# Altium schematic sheet Schematic.SchDoc
size C; SheetNumber: 1; SheetTotal: 1
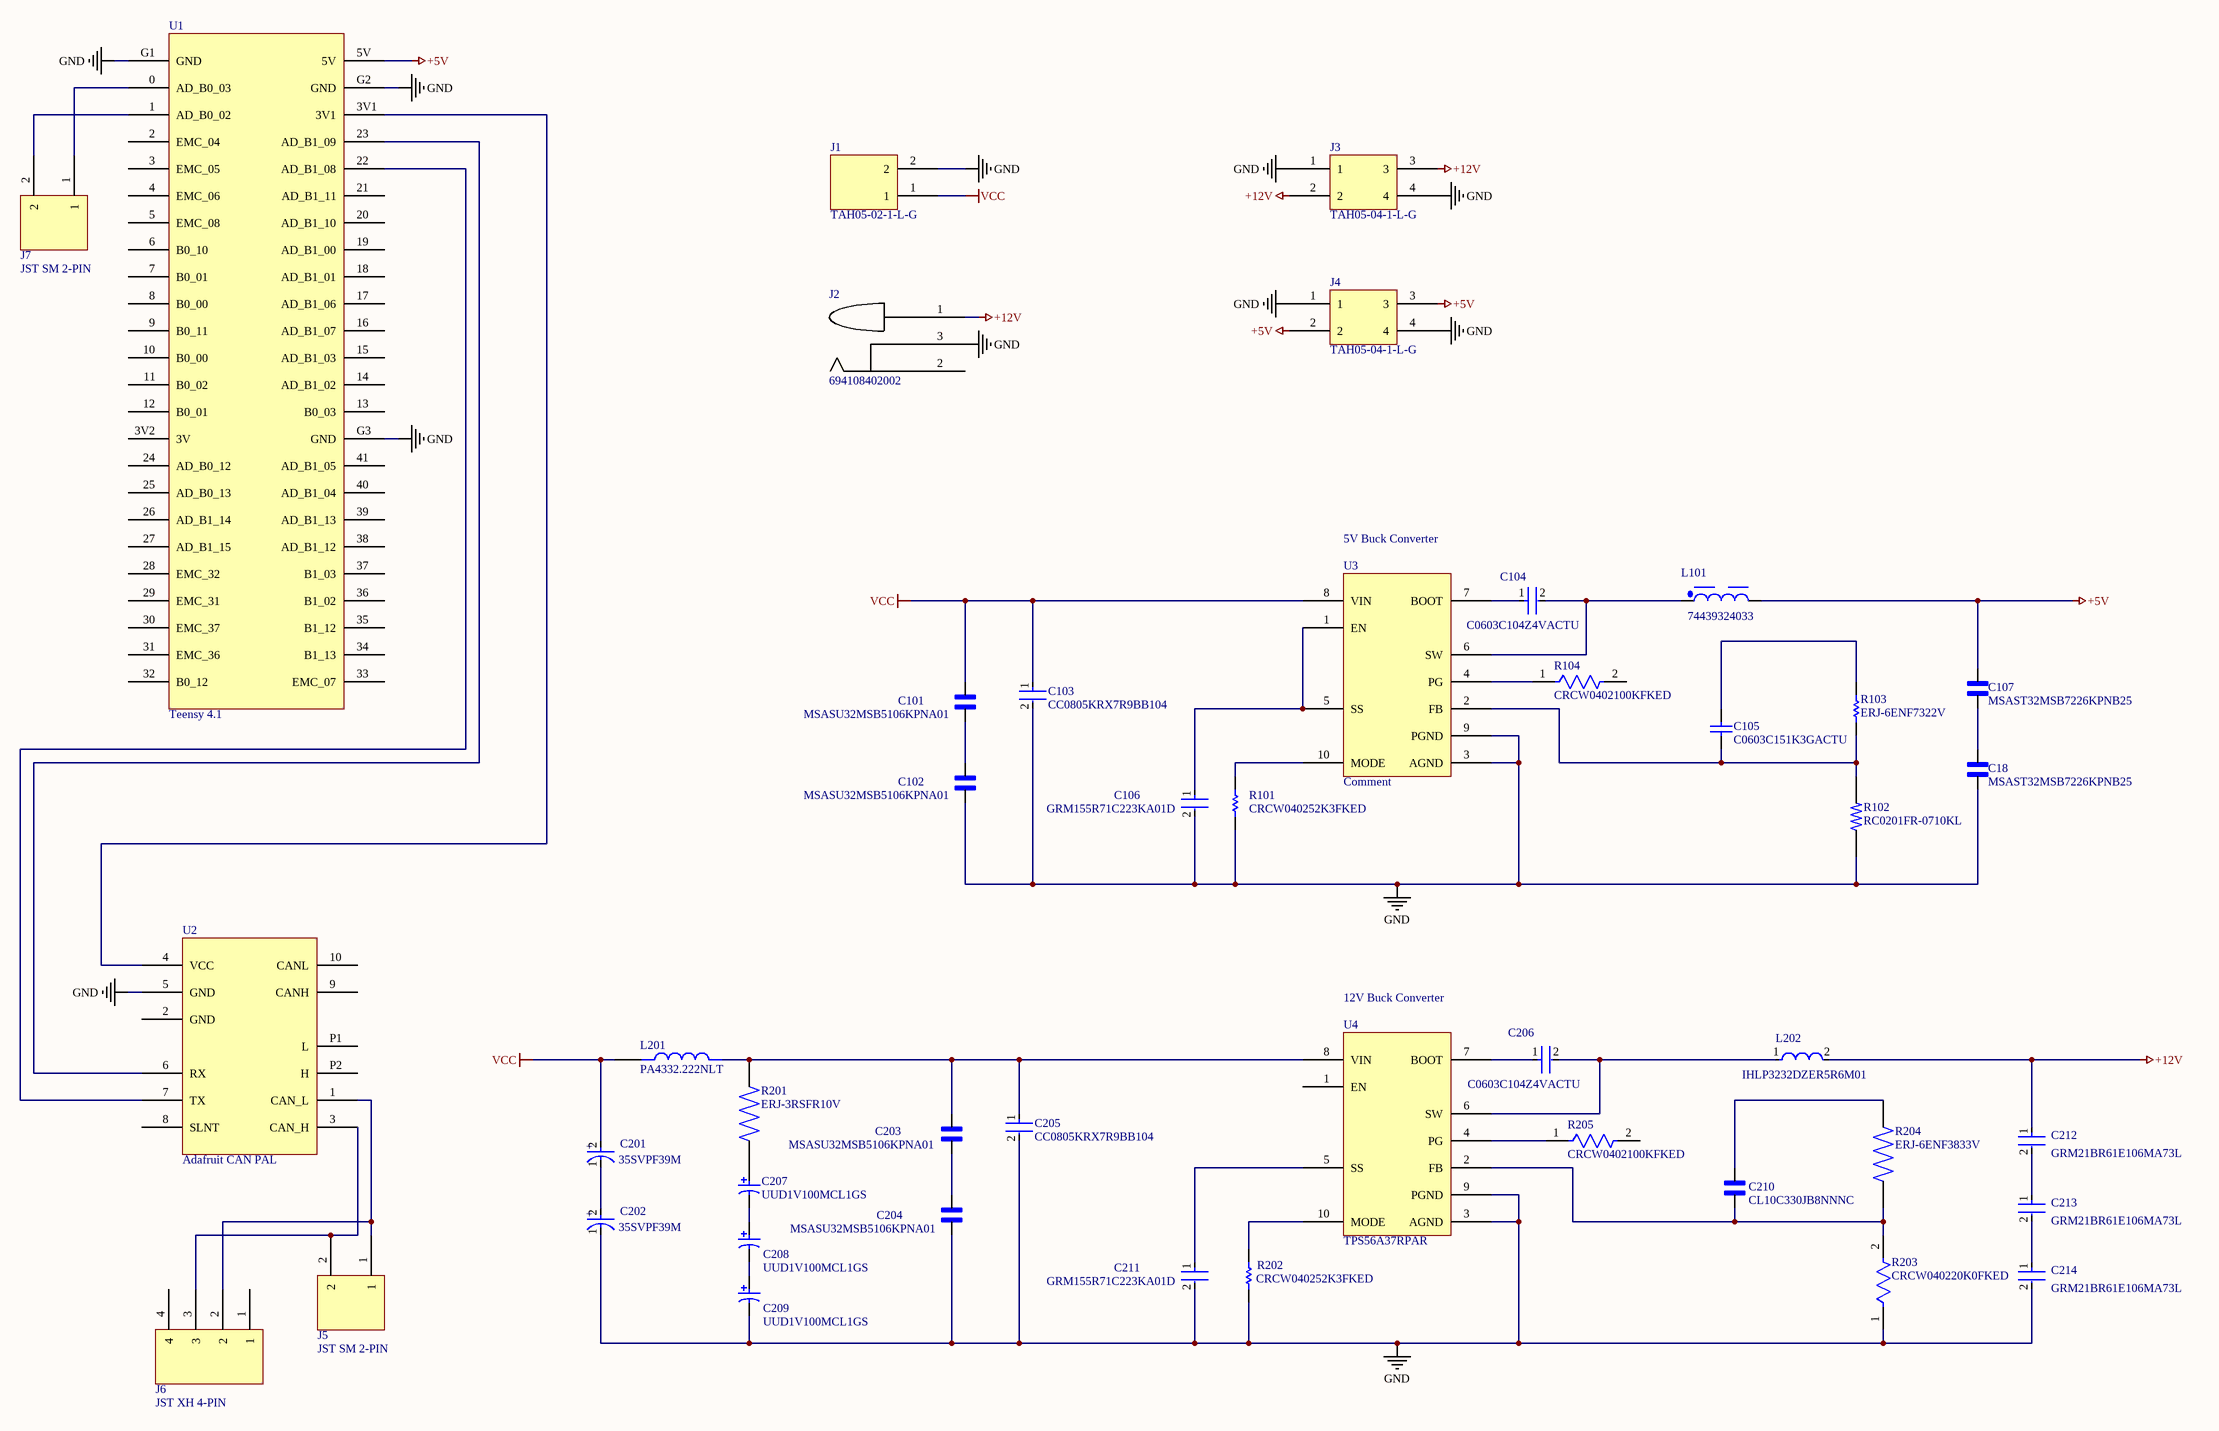
[diagram p0: Schematic.SchDoc]

## Parts
C18  MSAST32MSB7226KPNB25  [CAPC3225X270N]
C101  MSASU32MSB5106KPNA01  [CAPC3225X270N]
C102  MSASU32MSB5106KPNA01  [CAPC3225X270N]
C103  CC0805KRX7R9BB104  [FP-CC0805-0_85-MFG]
C104  C0603C104Z4VACTU  [FP-C0603C104Z4VACTU-MFG]
C105  C0603C151K3GACTU  [CAPC1608X87X35NL15T15]
C106  GRM155R71C223KA01D  [FP-GRM155-0_05-MFG]
C107  MSAST32MSB7226KPNB25  [CAPC3225X270N]
C201  35SVPF39M  [FP-OS-CON-SMT-E7-MFG]
C202  35SVPF39M  [FP-OS-CON-SMT-E7-MFG]
C203  MSASU32MSB5106KPNA01  [CAPC3225X270N]
C204  MSASU32MSB5106KPNA01  [CAPC3225X270N]
C205  CC0805KRX7R9BB104  [FP-CC0805-0_85-MFG]
C206  C0603C104Z4VACTU  [FP-C0603C104Z4VACTU-MFG]
C207  UUD1V100MCL1GS  [NIC-CAPA2-5X5.8_V]
C208  UUD1V100MCL1GS  [NIC-CAPA2-5X5.8_V]
C209  UUD1V100MCL1GS  [NIC-CAPA2-5X5.8_V]
C210  CL10C330JB8NNNC  [CL10C330JB8NNNC]
C211  GRM155R71C223KA01D  [FP-GRM155-0_05-MFG]
C212  GRM21BR61E106MA73L  [FP-GRM21B-0_15-IPC_A]
C213  GRM21BR61E106MA73L  [FP-GRM21B-0_15-IPC_A]
C214  GRM21BR61E106MA73L  [FP-GRM21B-0_15-IPC_A]
J1  TAH05-02-1-L-G  [TAH05-02-1-L-G]
J2  694108402002  [694108402002]
J3  TAH05-04-1-L-G  [TAH05-04-1-L-G]
J4  TAH05-04-1-L-G  [TAH05-04-1-L-G]
J5  JST SM 2-PIN  [JST SM 2-PIN]
J6  JST XH 4-PIN  [JST XH 4-PIN]
J7  JST SM 2-PIN  [JST SM 2-PIN]
L101  74439324033  [WE-XHMI_4030]
L201  PA4332.222NLT  [PA4332.222NLT]
L202  IHLP3232DZER5R6M01  [FP-IHLP-3232DZ-FP_2_413x5-MFG]
R101  CRCW040252K3FKED  [RESC1005X40X25LL05T05]
R102  RC0201FR-0710KL  [RESC0603X26N]
R103  ERJ-6ENF7322V  [RESC2013X70X40LL20T20]
R104  CRCW0402100KFKED  [FP-CRCW0402-e3-IPC_C]
R201  ERJ-3RSFR10V  [ERJ-3RSFR10V]
R202  CRCW040252K3FKED  [RESC1005X40X25LL05T05]
R203  CRCW040220K0FKED  [FP-CRCW0402-e3-IPC_B]
R204  ERJ-6ENF3833V  [RESC2012X70N]
R205  CRCW0402100KFKED  [FP-CRCW0402-e3-IPC_C]
U1  Teensy 4.1  [Teensy 4.1]
U2  Adafruit CAN PAL  [ADAFRUIT CAN PAL]
U3  Comment  [TPS56A37RPAR]
U4  TPS56A37RPAR  [TPS56A37RPAR]

## Nets
+5V: C107.2 J4.2 J4.3 L101.2 U1.5V
+12V: C212.1 J2.1 J3.2 J3.3 L202.2
GND: C18.1 C102.1 C103.2 C106.2 C202.1(C) C204.1 C205.2 C209.2 C211.2 C214.2 J1.2 J2.3 J3.1 J3.4 J4.1 J4.4 R101.1 R102.1 R202.1 R203.1 U1.G1(GND) U1.G2(GND) U1.G3(GND) U2.5(GND) U3.3(AGND) U3.9(PGND) U4.3(AGND) U4.9(PGND)
VCC: C101.2 C103.1 C201.2(A) J1.1 L201.1 U3.8(VIN)
NetC18_2: C18.2 C107.1
NetC101_1: C101.1 C102.2
NetC104_1: C104.1 U3.7(BOOT)
NetC104_2: C104.2 L101.1 U3.6(SW)
NetC105_1: C105.1 R102.2 R103.1 U3.2(FB)
NetC105_2: C105.2 R103.2
NetC106_1: C106.1 U3.1(EN) U3.5(SS)
NetC201_1: C201.1(C) C202.2(A)
NetC203_1: C203.1 C204.2
NetC203_2: C203.2 C205.1 L201.2 R201.2 U4.8(VIN)
NetC206_1: C206.1 U4.7(BOOT)
NetC206_2: C206.2 L202.1 U4.6(SW)
NetC207_1: C207.1 R201.1
NetC207_2: C207.2 C208.1
NetC208_2: C208.2 C209.1
NetC210_1: C210.1 R203.2 R204.1 U4.2(FB)
NetC210_2: C210.2 R204.2
NetC211_1: C211.1 U4.5(SS)
NetC212_2: C212.2 C213.1
NetC213_2: C213.2 C214.1
NetJ5_1: J5.1 J6.2 U2.1(CAN_L)
NetJ5_2: J5.2 J6.3 U2.3(CAN_H)
NetJ7_1: J7.1 U1.0(AD_B0_03)
NetJ7_2: J7.2 U1.1(AD_B0_02)
NetR101_2: R101.2 U3.10(MODE)
NetR104_1: R104.1 U3.4(PG)
NetR202_2: R202.2 U4.10(MODE)
NetR205_1: R205.1 U4.4(PG)
NetU1_3V1: U1.3V1 U2.4(VCC)
NetU1_22: U1.22(AD_B1_08) U2.7(TX)
NetU1_23: U1.23(AD_B1_09) U2.6(RX)

Not connected (* = marked no-connect by the designer): J2 2; J6 1 4; R104 2; R205 2; U1 2(EMC_04) 3(EMC_05) 3V2(3V) 4(EMC_06) 5(EMC_08) 6(B0_10) 7(B0_01) 8(B0_00) 9(B0_11) 10(B0_00) 11(B0_02) 12(B0_01) 13(B0_03) 14(AD_B1_02) 15(AD_B1_03) 16(AD_B1_07) 17(AD_B1_06) 18(AD_B1_01) 19(AD_B1_00) 20(AD_B1_10) 21(AD_B1_11) 24(AD_B0_12) 25(AD_B0_13) 26(AD_B1_14) 27(AD_B1_15) 28(EMC_32) 29(EMC_31) 30(EMC_37) 31(EMC_36) 32(B0_12) 33(EMC_07) 34(B1_13) 35(B1_12) 36(B1_02) 37(B1_03) 38(AD_B1_12) 39(AD_B1_13) 40(AD_B1_04) 41(AD_B1_05); U2 2(GND) 8(SLNT) 9(CANH) 10(CANL) P1(L) P2(H); U4 1(EN)

## Notes on the sheet
- 5V Buck Converter
- 12V Buck Converter

## Library data of the parts
C18 C107 = MSAST32MSB7226KPNB25: MF: {'manufacturer': u'Taiyo Yuden'}; Package: None; Price: None; Value: *; MP: MSAST32MSB7226KPNB25; Availability: Unavailable
C101 C102 C203 C204 = MSASU32MSB5106KPNA01: 10uF 50V 10% Multilayer Ceramic Capacitor X5R 1210 (3225 Metric); MF: Taiyo Yuden; SnapEDA_Link: https://www.snapeda.com/parts/MSASU32MSB5106KPNA01/Taiyo+Yuden/view-part/?ref=snap; Package: 3225-2 TAIYO; Value: *; MP: MSASU32MSB5106KPNA01; Check_prices: https://www.snapeda.com/parts/MSASU32MSB5106KPNA01/Taiyo+Yuden/view-part/?ref=eda
C103 C205 = CMP-2100-03606-3: CAP CER 0.1UF 50V X7R 0805; Manufacturer: Yageo; Tolerance: 0.1; Capacitance: 100 nF; Value: 100 nF; Material: Ceramic; Device Class L1: Passive Components; ComponentLink2Description: Datasheet; Package: CC0805-0.85; Manufacturer Part Number: CC0805KRX7R9BB104; Digikey Description: CAP CER 0.1UF 50V X7R 0805; Device Class L3: Ceramic Capacitors; Temperature: -30°C to +85°C; Temperature Characteristic: X7R; Voltage Rating: 50 V; Height: 0.95mm; RoHS: TRUE; Ipc Land Pattern Name: CAPC200125X85; Device Class L2: Capacitors; Category: Cap; Temperature Range Low: -30°C; Temperature Range High: +85°C; Mouser Description: Multilayer Ceramic Capacitors MLCC - SMD/SMT 100nF 50V X7R 10%; Footprint Url: http://www.yageo.com/exep/pages/download/literatures/UPY-C_GEN_24.pdf; Automotive: No; Octopart: https://octopart.com/cc0805krx7r9bb104-yageo-192993; Lead Free: Yes; ComponentLink2URL: http://www.yageo.com/documents/recent/UPY-GPHC_Y5V_6.3V-to-50V_8.pdf
C104 C206 = CMP-2006-03071-2: CAP CER 0.1UF 16V Y5V 0603; Tolerance: 80%; Capacitance: 100nF; Dielectric Material: Ceramic; Radiation Hardening: No; Lead Free: Lead Free; Package Quantity: 4000; Voltage Rating: 16V; Width: 0.031inch; Thickness: 0.034inch; Max Operating Temperature: 85°C; Case/Package: 0603; Depth: 0.8mm; Case Code (Metric): 1608; Voltage Rating (DC): 16V; Packaging: Tape and Reel; Min Operating Temperature: -30°C; REACH SVHC: No SVHC; Lead Pitch: 0.7mm; Case Code (Imperial): 0603; Series: C; Termination: SMD/SMT; RoHS Compliant: Yes; Length: 1.6mm; Height: 0.8mm; Construction: Flat; Dielectric: Y5V; Mount: Surface Mount; Number of Pins: 2
C105 = CMP-2006-03084-1: Manufacturer: Kemet; Part Number: C0603C151K3GACTU
C106 C211 = CMP-1034-01948-3: Chip Multilayer Ceramic Capacitors for General Purpose, 0402, 22000pF, X7R, 15%, 10%, 16V; Capacitance: 22nF; Min Operating Temperature: -55°C; Case Code (Imperial): 0402; Voltage Rating: 16V; REACH SVHC: No SVHC; Voltage Rating (DC): 16V; Material: Ceramic; Voltage: 16V; Package Quantity: 10000; Width: 0.02inch; Length: 1mm; Weight: 2.3E-05oz; Case Code (Metric): 1005; Radiation Hardening: No; Depth: 0.5mm; Tolerance: 10%; Height: 0.5mm; Mount: Surface Mount; Packaging: Tape and Reel; Number of Pins: 2; Max Operating Temperature: 125°C; Thickness: 0.022inch; Lead Free: Lead Free; Termination: SMD/SMT; Case/Package: 0402; Dielectric: X7R
C201 C202 = CMP-05428-001379-1: Conductive Polymer Aluminum Solid Capacitors (OS-CON) 39uF ±20% 35V RADIAL SMT 8x6.9mm; Ripple Current: 2.8A; Life (Hours): 5000Hour; Polarity: Polar; ESR (Equivalent Series Resistance): 30mR; Dissipation Factor: 12%; Leakage Current: 273uA; Height: 6.9mm; Tolerance: 20%; Series: OS-CON™, SVPF; Lead Free: Lead Free; Diameter: 8mm; Case/Package: Radial; Voltage: 35V; Package Quantity: 1000; Min Operating Temperature: -55°C; Packaging: Tape and Reel; Height - Seated (Max): 0.276inch; Voltage Rating (DC): 35V; Ripple Current (AC): 2.8A; Termination: SMD/SMT; Number of Pins: 7; Max Operating Temperature: 105°C; Voltage Rating: 35V; RoHS Compliant: Yes; REACH SVHC: No SVHC; Length: 6.9mm; Capacitance: 39uF; Mount: Surface Mount
C207-C209 = CMP-0687-00026-1: Aluminum Electrolytic Capacitor, UD Series, Low Impedance, 10 uF, 35 V, + / - 20%, -55 to 105 degC, Chip Type, 5 x 5.8 mm D x L, Pb-Free, Reel; Manufacturer: Nichicon; Endurance Time: 2000 h; Tolerance Rated Capacitance: -20 to 20%; Packing: Dia382mm Reel; Rated Capacitance: 10 uF; Rated Ripple Current (at 100kHz): 150 mA; Impedance: 0.76 Ohm; Rated Voltage: 35 V; DatasheetVersion: 08/2012; Mounting Technology: Surface Mount; ComponentLink1URL: http://www.nichicon.co.jp/; ComponentLink1Description: Manufacturer URL; PackageDescription: 2-Pin Surface Mount Device, Diameter 5 mm, Height 5.8 mm, Pitch 4.4 mm; RoHS: TRUE; ComponentLink3Description: Package Specification; ComponentLink3URL: http://products.nichicon.co.jp/en/pdf/XJA043/e-ud.pdf; PartNumber: UUD1V100MCL1GS; PackageReference: CAPAE-D5H5.8; ComponentLink2URL: http://products.nichicon.co.jp/en/pdf/XJA043/e-ud.pdf; Diameter: 5 mm; ComponentLink2Description: Datasheet; Length: 5.8 mm
C212-C214 = CMP-06035-013048-1: Chip Multilayer Ceramic Capacitors for General Purpose, 0805, 10uF, X5R, 15%, 20%, 25V; Max Operating Temperature: 85°C; Package Quantity: 3000; Case/Package: 0805; Depth: 1.25mm; Case Code (Imperial): 0805; Termination: SMD/SMT; Width: 0.049inch; Packaging: Tape and Reel; Tolerance: 20%; Height: 1.25mm; Min Operating Temperature: -55°C; Capacitance: 10uF; Weight: 0.000335oz; Voltage Rating (DC): 25V; Dielectric: X5R; Length: 2mm; Thickness: 0.055inch; Voltage Rating: 25V; Resistor Type: Ceramic; Lead Free: Lead Free; Case Code (Metric): 2012; Mount: Surface Mount; REACH SVHC: No SVHC
L101 = CMP-03913-148605656-1: Power Inductor, 3.3UH, Shielded, 7.1A Rohs Compliant: Yes
L202 = CMP-02424-000336-1: Commercial Inductors, High Saturation Series 5.6uH 6.8A 35.5mΩ 20%; Test Frequency: 100kHz; DC Resistance (DCR): 35.5mR; Shielding: Shielded; Saturation Current: 16.7A; Self Resonant Frequency: 18MHz; Inductance: 5.6uH; RMS Current (Irms): 6.8A; Military Standard: Not; Packaging: Tape and Reel; Length: 0.34inch; Depth: 8.94mm; Current Rating: 6.8A; Case/Package: 3232; Height: 4mm; Package Quantity: 500; Min Operating Temperature: -55°C; Mount: Surface Mount; Height - Seated (Max): 0.157inch; Radiation Hardening: No; Width: 8.18mm; Lead Free: Lead Free; Tolerance: 20%; Max DC Current: 16.7A; Inductance Tolerance: 20%; Max Operating Temperature: 125°C; Termination: SMD/SMT
R101 R202 = CMP-2002-00086-1: Manufacturer: Vishay Dale; Part Number: CRCW040252K3FKED
R102 = RC0201FR-0710KL: 10 kOhms Â±1% 0.05W, 1/20W Chip Resistor 0201 (0603 Metric) Moisture Resistant Thick Film; MF: Yageo; SnapEDA_Link: https://www.snapeda.com/parts/RC0201FR-0710KL/Yageo/view-part/?ref=snap; Package: 0201 Yageo; Value: *; MP: RC0201FR-0710KL; Check_prices: https://www.snapeda.com/parts/RC0201FR-0710KL/Yageo/view-part/?ref=eda
R103 = CMP-2001-00287-1: Manufacturer: Panasonic; Part Number: ERJ-6ENF7322V
R104 R205 = CMP-2002-08123-3: RES Thick Film, 100kΩ, 1%, 0.063W, 100ppm/°C, 0402; Power Rating: 63mW; Resistance: 100kR; Voltage Rating (DC): 50V; Lead Free: Lead Free; Height: 0.35mm; Contact Plating: Tin; Min Operating Temperature: -55°C; Package Quantity: 10000; Case/Package: 0402; Temperature Coefficient: 100ppm/°C; Number of Terminations: 2; Packaging: Tape and Reel; Max Power Dissipation: 63mW; Case Code (Metric): 1005; Mount: Surface Mount; Width: 0.02inch; Termination: SMD/SMT; Length: 1mm; Number of Pins: 2; Weight: 2.3E-05oz; Radiation Hardening: No; Tolerance: 1%; Military Standard: Not; Features: Automotive AEC-Q200; Depth: 0.5mm; Composition: Thick Film; Max Operating Temperature: 155°C; Voltage Rating: 50V; Case Code (Imperial): 0402
R203 = CMP-2002-08356-2: RES Thick Film, 20kΩ, 1%, 0.063W, 100ppm/°C, 0402; Max Power Dissipation: 63mW; Working Voltage: 50V; Resistance: 20kR; Contact Plating: Tin; Packaging: Tape and Reel; Height: 0.35mm; Case Code (Imperial): 0402; Tolerance: 1%; Width: 0.5mm; Composition: Thick Film; Mount: Surface Mount; Termination: SMD/SMT; Number of Pins: 2; Number of Terminations: 2; Length: 1mm; Temperature Coefficient: 100ppm/°C; Case Code (Metric): 1005; Voltage Rating: 50V; Lead Free: Lead Free; Voltage Rating (DC): 50V; Min Operating Temperature: -55°C; Max Operating Temperature: 155°C; Package Quantity: 10; Radiation Hardening: No; Weight: 2.3E-05oz; Military Standard: Not; Case/Package: 0402; Power Rating: 63mW; Depth: 0.5mm; Features: Automotive AEC-Q200
R204 = ERJ-6ENF3833V: Res Thick Film 0805 383K Ohm 1% 1/8W 100ppm/C Molded SMD SMD Punched Carrier T/R; MF: Panasonic; SnapEDA_Link: https://www.snapeda.com/parts/ERJ-6ENF3833V/Panasonic/view-part/?ref=snap; Package: 2012-2 Panasonic; Value: *; MP: ERJ-6ENF3833V; Check_prices: https://www.snapeda.com/parts/ERJ-6ENF3833V/Panasonic/view-part/?ref=eda
U1 = Teensy 4.1: Microcontroller
U3 = TPS56A37RPAR